# Altium schematic sheet HUB.SchDoc
size A; SheetNumber: 1; SheetTotal: 2
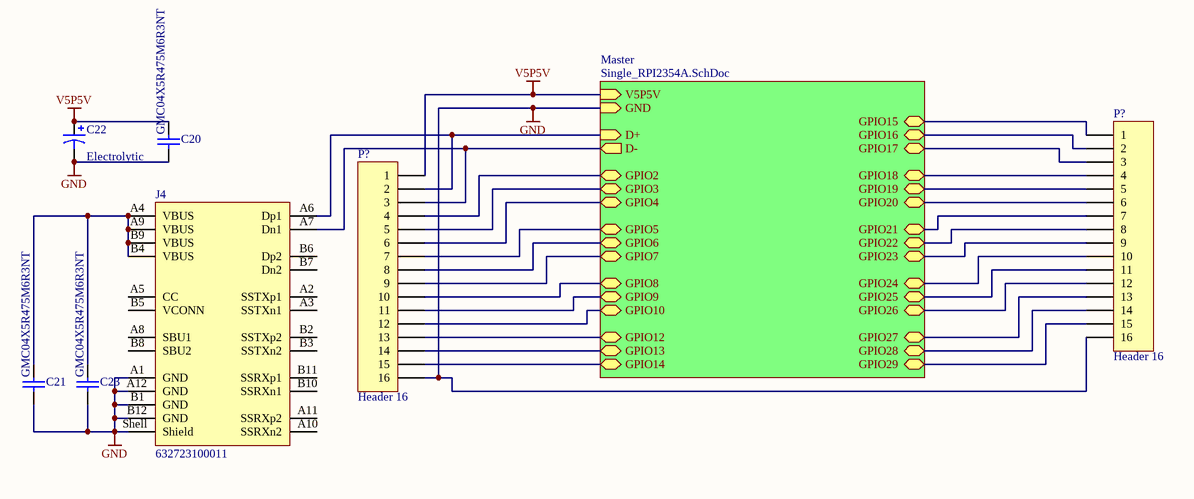
[diagram p0: HUB.SchDoc]

## Parts
(Parts that share a designator on the sheet are numbered #1, #2 ... from top to bottom, then left to right.)
C20  GMC04X5R475M6R3NT  [0402]
C21  GMC04X5R475M6R3NT  [0402]
C22  Electrolytic  [Axial C - small]
C23  GMC04X5R475M6R3NT  [0402]
J4  632723100011  [632723100011]
P?#1  Header 16  [HDR2X8]
P?#2  Header 16  [HDR2X8]

## Sub-sheets
Master = Single_RPI2354A.SchDoc: V5P5V (in), GND (in), D+ (in), D- (out), GPIO2 (bidir), GPIO3 (bidir), GPIO4 (bidir), GPIO5 (bidir), GPIO6 (bidir), GPIO7 (bidir), GPIO8 (bidir), GPIO9 (bidir), GPIO10 (bidir), GPIO15 (bidir), GPIO16 (bidir), GPIO18 (bidir), GPIO19 (bidir), GPIO21 (bidir), GPIO22 (bidir), GPIO24 (bidir), GPIO25 (bidir), GPIO27 (bidir), GPIO28 (bidir), GPIO29 (bidir), GPIO12 (bidir), GPIO13 (bidir), GPIO14 (bidir), GPIO17 (bidir), GPIO20 (bidir), GPIO23 (bidir), GPIO26 (bidir)

## Nets
GND: C20.1 C21.1 C22.2 C23.1 J4.A1(GND) J4.A12(GND) J4.B1(GND) J4.B12(GND) J4.Shell(Shield) P?#1.16 P?#2.16 ; sheet Master/GND
V5P5V: C20.2 C22.1 P?#2.1 ; sheet Master/V5P5V
NetC21_2: C21.2 C23.2 J4.A4(VBUS) J4.A9(VBUS) J4.B4(VBUS) J4.B9(VBUS)
NetJ4_A6: J4.A6(Dp1) P?#2.2 ; sheet Master/D+
NetJ4_A7: J4.A7(Dn1) P?#2.3 ; sheet Master/D-
NetP?#1_1: P?#1.1 ; sheet Master/GPIO15
NetP?#1_2: P?#1.2 ; sheet Master/GPIO16
NetP?#1_3: P?#1.3 ; sheet Master/GPIO17
NetP?#1_4: P?#1.4 ; sheet Master/GPIO18
NetP?#1_5: P?#1.5 ; sheet Master/GPIO19
NetP?#1_6: P?#1.6 ; sheet Master/GPIO20
NetP?#1_7: P?#1.7 ; sheet Master/GPIO21
NetP?#1_8: P?#1.8 ; sheet Master/GPIO22
NetP?#1_9: P?#1.9 ; sheet Master/GPIO23
NetP?#1_10: P?#1.10 ; sheet Master/GPIO24
NetP?#1_11: P?#1.11 ; sheet Master/GPIO25
NetP?#1_12: P?#1.12 ; sheet Master/GPIO26
NetP?#1_13: P?#1.13 ; sheet Master/GPIO27
NetP?#1_14: P?#1.14 ; sheet Master/GPIO28
NetP?#1_15: P?#1.15 ; sheet Master/GPIO29
NetP?#2_4: P?#2.4 ; sheet Master/GPIO2
NetP?#2_5: P?#2.5 ; sheet Master/GPIO3
NetP?#2_6: P?#2.6 ; sheet Master/GPIO4
NetP?#2_7: P?#2.7 ; sheet Master/GPIO5
NetP?#2_8: P?#2.8 ; sheet Master/GPIO6
NetP?#2_9: P?#2.9 ; sheet Master/GPIO7
NetP?#2_10: P?#2.10 ; sheet Master/GPIO8
NetP?#2_11: P?#2.11 ; sheet Master/GPIO9
NetP?#2_12: P?#2.12 ; sheet Master/GPIO10
NetP?#2_13: P?#2.13 ; sheet Master/GPIO12
NetP?#2_14: P?#2.14 ; sheet Master/GPIO13
NetP?#2_15: P?#2.15 ; sheet Master/GPIO14

Not connected (* = marked no-connect by the designer): J4 A2(SSTXp1) A3(SSTXn1) A5(CC) A8(SBU1) A10(SSRXn2) A11(SSRXp2) B2(SSTXp2) B3(SSTXn2) B5(VCONN) B6(Dp2) B7(Dn2) B8(SBU2) B10(SSRXn1) B11(SSRXp1)

## Library data of the parts
C20 C21 C23 = Cap: Capacitor; Value: 100pF; Published: 8-Jun-2000; LatestRevisionDate: 17-Jul-2002; LatestRevisionNote: Re-released for DXP Platform.; PackageReference: RAD-0.3; Publisher: Altium Limited; PackageDescription: Radial Cap, Thru-Hole; 2 Leads; 0.3 in Pin Spacing
C22 = Cap Pol1: Polarized Capacitor (Radial); Value: 100pF; Published: 8-Jun-2000; LatestRevisionDate: 17-Jul-2002; LatestRevisionNote: Re-released for DXP Platform.; PackageReference: RB7.6-15; Publisher: Altium Limited; PackageDescription: Polarized Capacitor (Radial); 2 Leads
J4 = CMP-1502-03213-4: USB Connector, 24 Contact(s), Female, Right Angle, Solder and Surface Mount Terminal, Receptacle; Number of Contacts: 24; Voltage Rating: 20V; Contact Resistance: 30mΩ; Current Rating: 5A; USB Standard: USB 3.1; Insulation Resistance: 1GΩ; Pin Length: 1.5mm; Gender: Receptacle; Connector Type: USB; Min Operating Temperature: -40°C; Orientation: Horizontal; Mount: Surface Mount, Through Hole; Contact Material: Gold, Nickel; Packaging: Tape and Reel; Number of Pins: 24; Height: 3.16mm; RoHS: Compliant; Max Operating Temperature: 105°C
P?#1 P?#2 = Header 16: Header, 16-Pin; LatestRevisionDate: 17-Jul-2002; LatestRevisionNote: Re-released for DXP Platform.; Publisher: Altium Limited